# Altium schematic sheet Buck_Boost_Converter.SchDoc
size A3; SheetNumber: 2; SheetTotal: 4; SheetSize: A3
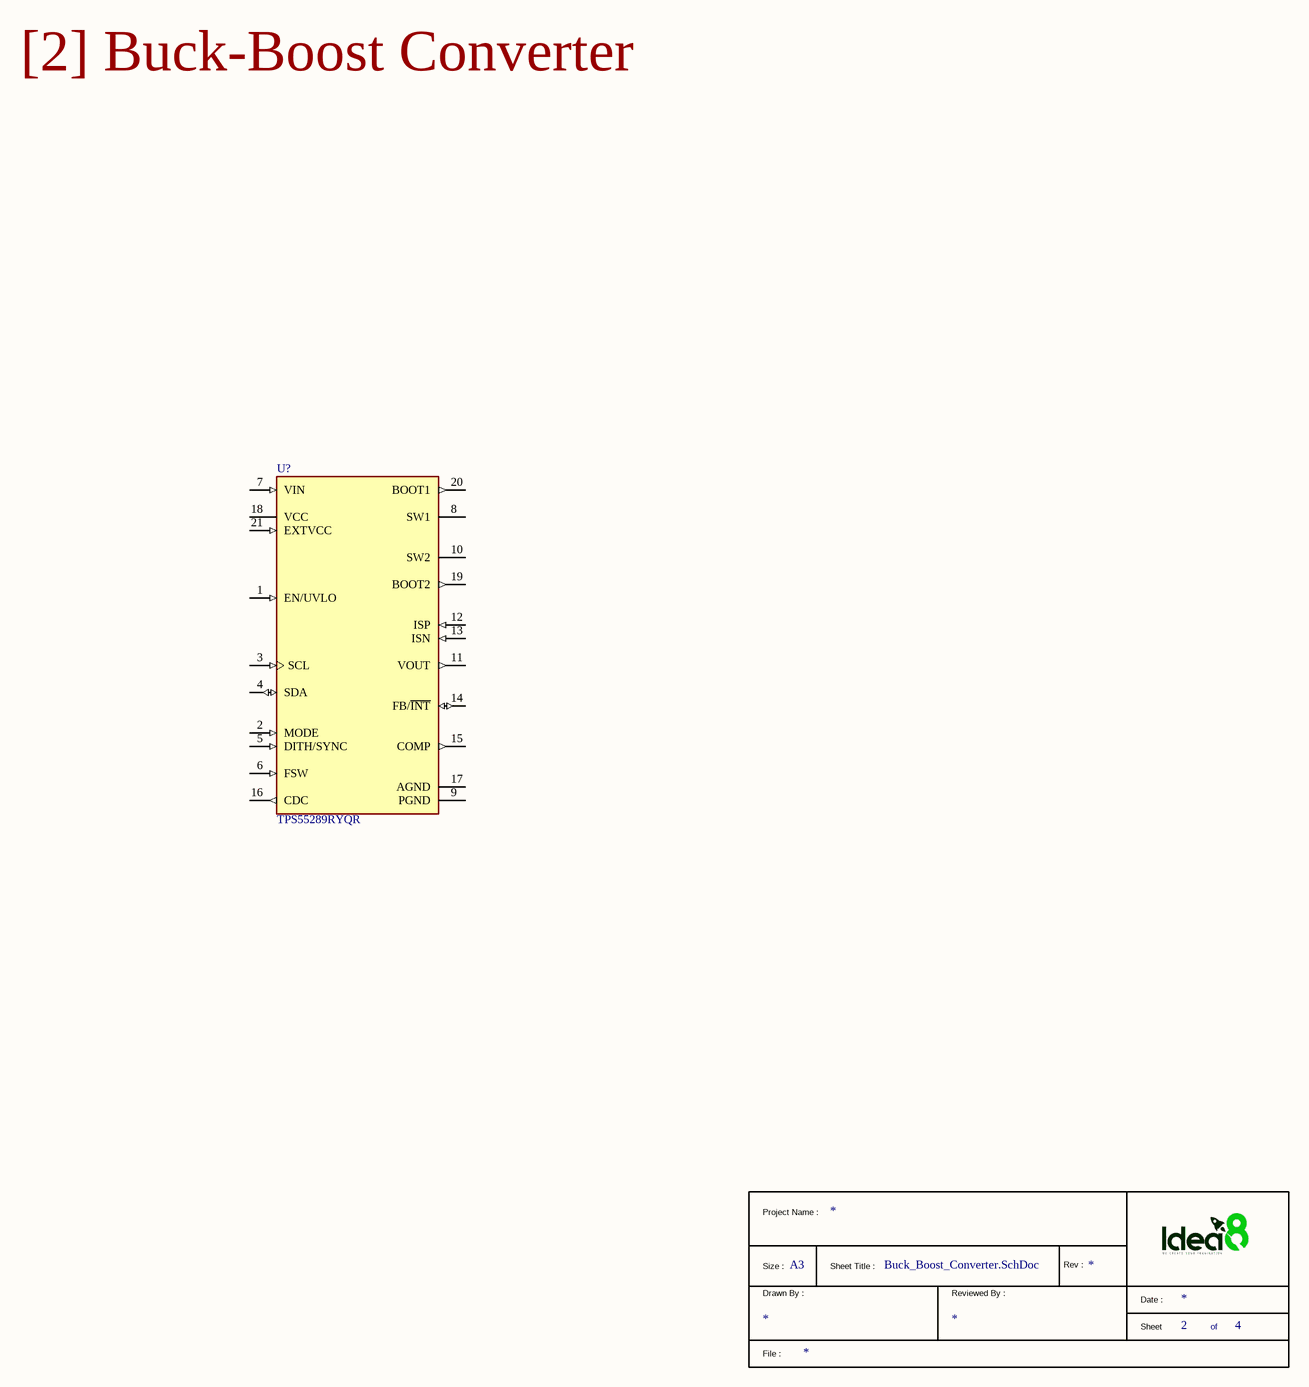
[diagram p0: Buck_Boost_Converter.SchDoc]

## Parts
*  TitleBlock1  (value not drawn)  (graphical)
U?  TPS55289RYQR  [TPS55289RYQR_VQFN-HR-21(3x5)]

## Nets

Not connected (* = marked no-connect by the designer): U? 1(EN/UVLO) 2(MODE) 3(SCL) 4(SDA) 5(DITH/SYNC) 6(FSW) 7(VIN) 8(SW1) 9(PGND) 10(SW2) 11(VOUT) 12(ISP) 13(ISN) 14(FB/~{INT}) 15(COMP) 16(CDC) 17(AGND) 18(VCC) 19(BOOT2) 20(BOOT1) 21(EXTVCC)

## Notes on the sheet
- [2] Buck-Boost Converter
- (in symbol TitleBlock1) Project Name :; Size :; Sheet Title :; Rev :; Drawn By :; Reviewed By :; Date :; Sheet; of; File :

## Library data of the parts
U? = TI TPS55289RYQR: TPS55289 Synchronous Buck-Boost Converter; Manufacturer: TI; Manufacturer Part Number: TPS55289RYQR; DigiKey Part Number: 296-TPS55289RYQRTR-ND; LCSC Part Number: C5942077; Package: VQFN-HR-21(3x5); Type: SMD